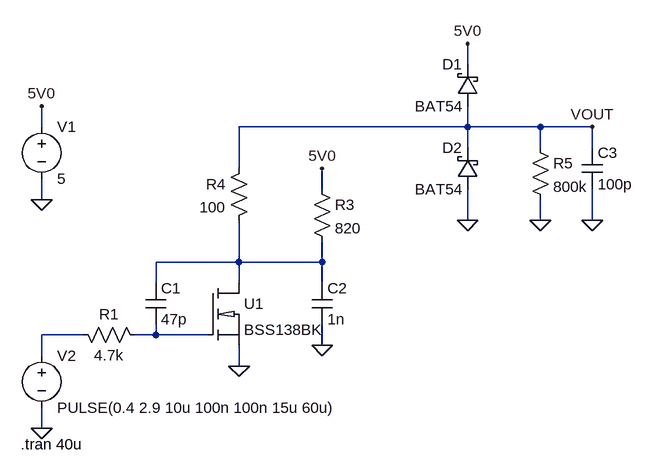
[diagram p0: schematic OneWire.asc]
OneWire.asc, the LTspice schematic file:
Version 4
SHEET 1 1144 680
WIRE 624 -16 624 -48
WIRE -32 80 -32 48
WIRE 624 80 624 48
WIRE 624 80 272 80
WIRE 736 80 624 80
WIRE 816 80 736 80
WIRE 624 112 624 80
WIRE 736 112 736 80
WIRE 816 112 816 80
WIRE 272 144 272 80
WIRE 400 176 400 144
WIRE -32 192 -32 160
WIRE 624 224 624 176
WIRE 736 224 736 192
WIRE 816 224 816 176
WIRE 272 288 272 224
WIRE 272 288 144 288
WIRE 400 288 400 256
WIRE 400 288 272 288
WIRE 144 320 144 288
WIRE 272 320 272 288
WIRE 400 320 400 288
WIRE 32 400 -32 400
WIRE 144 400 144 384
WIRE 144 400 112 400
WIRE 224 400 144 400
WIRE 400 416 400 384
WIRE -32 432 -32 400
WIRE 272 448 272 416
WIRE -32 544 -32 512
FLAG -32 48 5V0
FLAG -32 192 0
FLAG -32 544 0
FLAG 624 -48 5V0
FLAG 400 144 5V0
FLAG 736 224 0
FLAG 816 224 0
FLAG 624 224 0
FLAG 272 448 0
FLAG 400 416 0
FLAG 816 80 VOUT
SYMBOL voltage -32 64 R0
SYMATTR InstName V1
SYMATTR Value 5
SYMBOL voltage -32 416 R0
WINDOW 123 0 0 Left 0
WINDOW 39 0 0 Left 0
SYMATTR InstName V2
SYMATTR Value PULSE(0.4 2.9 10u 100n 100n 15u 60u)
SYMBOL res 16 384 M90
WINDOW 0 0 56 VBottom 2
WINDOW 3 32 56 VTop 2
SYMATTR InstName R1
SYMATTR Value 4.7k
SYMBOL cap 128 320 R0
SYMATTR InstName C1
SYMATTR Value 47p
SYMBOL cap 384 320 R0
SYMATTR InstName C2
SYMATTR Value 1n
SYMBOL res 384 160 R0
SYMATTR InstName R3
SYMATTR Value 820
SYMBOL res 288 128 M0
SYMATTR InstName R4
SYMATTR Value 100
SYMBOL schottky 640 48 R180
WINDOW 0 24 64 Left 2
WINDOW 3 24 0 Left 2
SYMATTR InstName D1
SYMATTR Value BAT54
SYMATTR Description Diode
SYMATTR Type diode
SYMBOL schottky 640 176 R180
WINDOW 0 24 64 Left 2
WINDOW 3 24 0 Left 2
SYMATTR InstName D2
SYMATTR Value BAT54
SYMATTR Description Diode
SYMATTR Type diode
SYMBOL res 720 96 R0
SYMATTR InstName R5
SYMATTR Value 800k
SYMBOL cap 800 112 R0
SYMATTR InstName C3
SYMATTR Value 100p
SYMBOL BSS138BK 224 320 R0
SYMATTR InstName U1
TEXT -64 568 Left 2 !.tran 40u

The netlist it stands for:
* OneWire.asc
V1 5V0 0 5
V2 N002 0 PULSE(0.4 2.9 10u 100n 100n 15u 60u)
R1 N002 N003 4.7k
C1 N001 N003 47p
C2 N001 0 1n
R3 5V0 N001 820
R4 VOUT N001 100
D1 VOUT 5V0 BAT54
D2 0 VOUT BAT54
R5 VOUT 0 800k
C3 VOUT 0 100p
XU1 N001 N003 0 BSS138BK BSS138BK  ; pins D G S
.model D D
.lib standard.dio
.tran 40u
.lib BSS138BK.lib
.backanno
.end